# Altium project MEZONNINE.PrjPcb
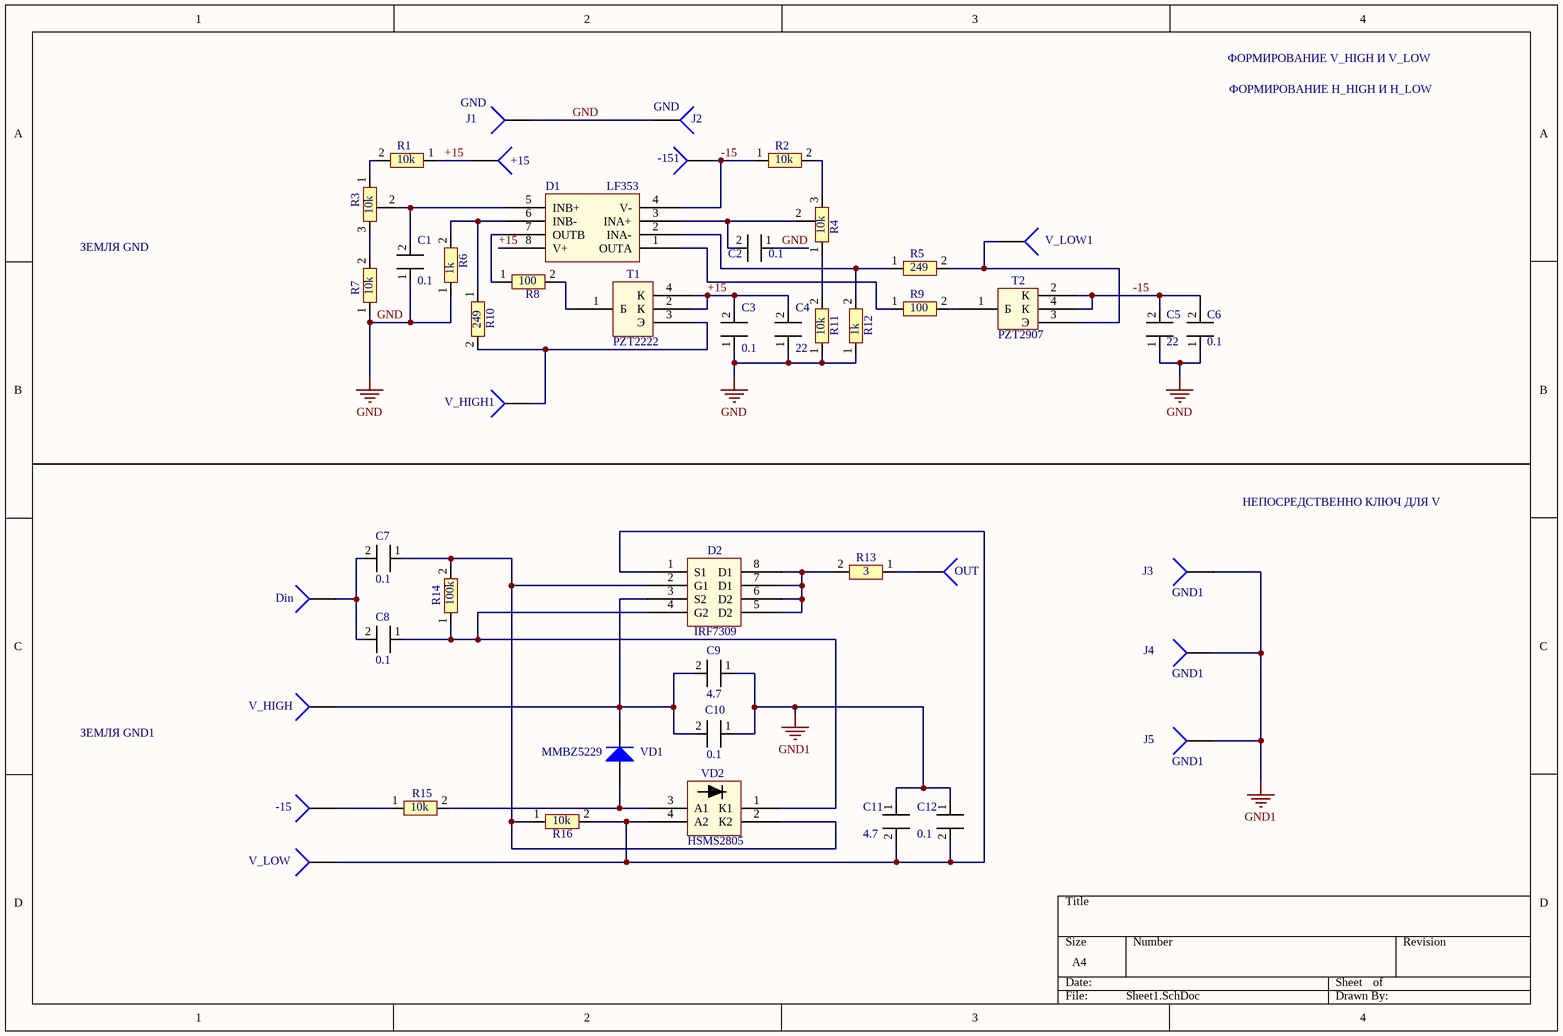
[diagram p0: Sheet1.SchDoc]
2 sheets, 69 parts. Net scope: global (net labels, ports and power ports of the same name join across sheets).
Board files: PCB.PcbDoc, V.PcbDoc, H.PcbDoc, V+H.PcbDoc
Sheets:
  Sheet1.SchDoc
  Sheet2.SchDoc

## Sheet Sheet1.SchDoc
size A4

### Parts
+15  (no value)  [PIN1]
-15  (no value)  [PIN1]
-151  (no value)  [PIN1]
C1  0.1  [CAP_SMALL]
C2  0.1  [CAP_SMALL]
C3  0.1  [CAP_SMALL]
C4  22  [Cap_BIG]
C5  22  [Cap_BIG]
C6  0.1  [CAP_SMALL]
C7  0.1  [CAP_SMALL]
C8  0.1  [CAP_SMALL]
C9  4.7  [CAP_SMALL]
C10  0.1  [CAP_SMALL]
C11  4.7  [CAP_SMALL]
C12  0.1  [CAP_SMALL]
D1  LF353  [SOIC127P600X175-8N]
D2  IRF7309  [SOIC127P600X175-8N]
Din  (no value)  [PIN1]
J1  GND  [PIN1]
J2  GND  [PIN1]
J3  GND1  [PIN1]
J4  GND1  [PIN1]
J5  GND1  [PIN1]
OUT  (no value)  [PIN1]
R1  10k  [RES]
R2  10k  [RES]
R3  10k  [PODSR_RES]
R4  10k  [PODSR_RES]
R5  249  [RES]
R6  1k  [RES]
R7  10k  [RES]
R8  100  [RES]
R9  100  [RES]
R10  249  [RES]
R11  10k  [RES]
R12  1k  [RES]
R13  3  [RES]
R14  100k  [RES]
R15  10k  [RES]
R16  10k  [RES]
T1  PZT2222  [SOT230P700X180-4N]
T2  PZT2907  [SOT230P700X180-4N]
V_HIGH  (no value)  [PIN1]
V_HIGH1  (no value)  [PIN1]
V_LOW  (no value)  [PIN1]
V_LOW1  (no value)  [PIN1]
VD1  MMBZ5229  [SOT-23_N]
VD2  HSMS2805  [SOT-143B]

### Nets
GND: C1.1 C2.1 C3.1 C4.1 C5.1 C6.1 J1.1 J2.1 R6.1 R7.1 R11.1 R12.1
GND1: C9.1 C10.1 C11.1 C12.1 J3.1 J4.1 J5.1
+15: +15.1 C3.2 C4.2 D1.8(V+) R1.1 T1.2(К) T1.4(К)
-15: -151.1 C5.2 C6.2 D1.4(V-) R2.1 T2.2(К) T2.4(К)
Net-15_1: -15.1 R15.1
NetC1_2: C1.2 D1.5(INB+) R3.2
NetC2_2: C2.2 D1.3(INA+) R4.2
NetC7_1: C7.1 D2.2(G1) R14.2 R16.1 VD2.2(К2)
NetC7_2: C7.2 C8.2 Din.1
NetC8_1: C8.1 D2.4(G2) R14.1 VD2.1(К1)
NetC9_2: C9.2 C10.2 D2.3(S2) V_HIGH.1 VD1.3(K)
NetC11_2: C11.2 C12.2 D2.1(S1) R16.2 V_LOW.1 VD2.4(А2)
NetD1_1: D1.1(OUTA) R9.1
NetD1_2: D1.2(INA-) R5.1 R12.2
NetD1_6: D1.6(INB-) R6.2 R10.1
NetD1_7: D1.7(OUTB) R8.1
NetD2_5: D2.5(D2) D2.6(D2) D2.7(D1) D2.8(D1) R13.2
NetOUT_1: OUT.1 R13.1
NetR1_2: R1.2 R3.1
NetR2_2: R2.2 R4.3
NetR3_3: R3.3 R7.2
NetR4_1: R4.1 R11.2
NetR5_2: R5.2 T2.3(Э) V_LOW1.1
NetR8_2: R8.2 T1.1(Б)
NetR9_2: R9.2 T2.1(Б)
NetR10_2: R10.2 T1.3(Э) V_HIGH1.1
NetR15_2: R15.2 VD1.1(A) VD2.3(А1)

### Notes on the sheet
- ФОРМИРОВАНИЕ V_HIGH И V_LOW
- ФОРМИРОВАНИЕ H_HIGH И H_LOW
- ЗЕМЛЯ GND
- НЕПОСРЕДСТВЕННО КЛЮЧ ДЛЯ V
- ЗЕМЛЯ GND1

### Library data of the parts
+15 -15 -151 Din J1-J5 OUT V_HIGH V_HIGH1 V_LOW V_LOW1 = Socket: LatestRevisionDate: 17-Jul-2002; LatestRevisionNote: Re-released for DXP Platform.; Publisher: Altium Limited
C1-C3 C6-C12 = CAP_SMALL
C4 C5 = CAP_BIG
R1 R2 R5-R16 = RES
R3 R4 = RES_PODSTR
T1 = PZT2222A
T2 = PZT2907A
VD1 = Diode BAS16: Silicon Switching Diode for High-Speed Switching; Note: Pin 2 is not connected and not drawn.; Published: 21-Mar-2003; LatestRevisionDate: 29-May-2009; LatestRevisionNote: IPC-7351 Footprint Added.; DatasheetVersion: Oct-1999; PackageVersion: Sep-2001; PackageReference: SOT-23; Publisher: Altium Limited; PackageDescription: 3-Pin SOT-23 Package 0.95 mm Pitch, 2.5 mm Lead Span; ComponentLink1Description: Manufacturer Link; ComponentLink1URL: http://www.infineon.com/; ComponentLink2Description: Datasheet; ComponentLink2URL: http://www.infineon.com/upload/Document/cmc_upload/documents/012/5331/bas16series.pdf
VD2 = HSMS-2805

## Sheet Sheet2.SchDoc
size A4
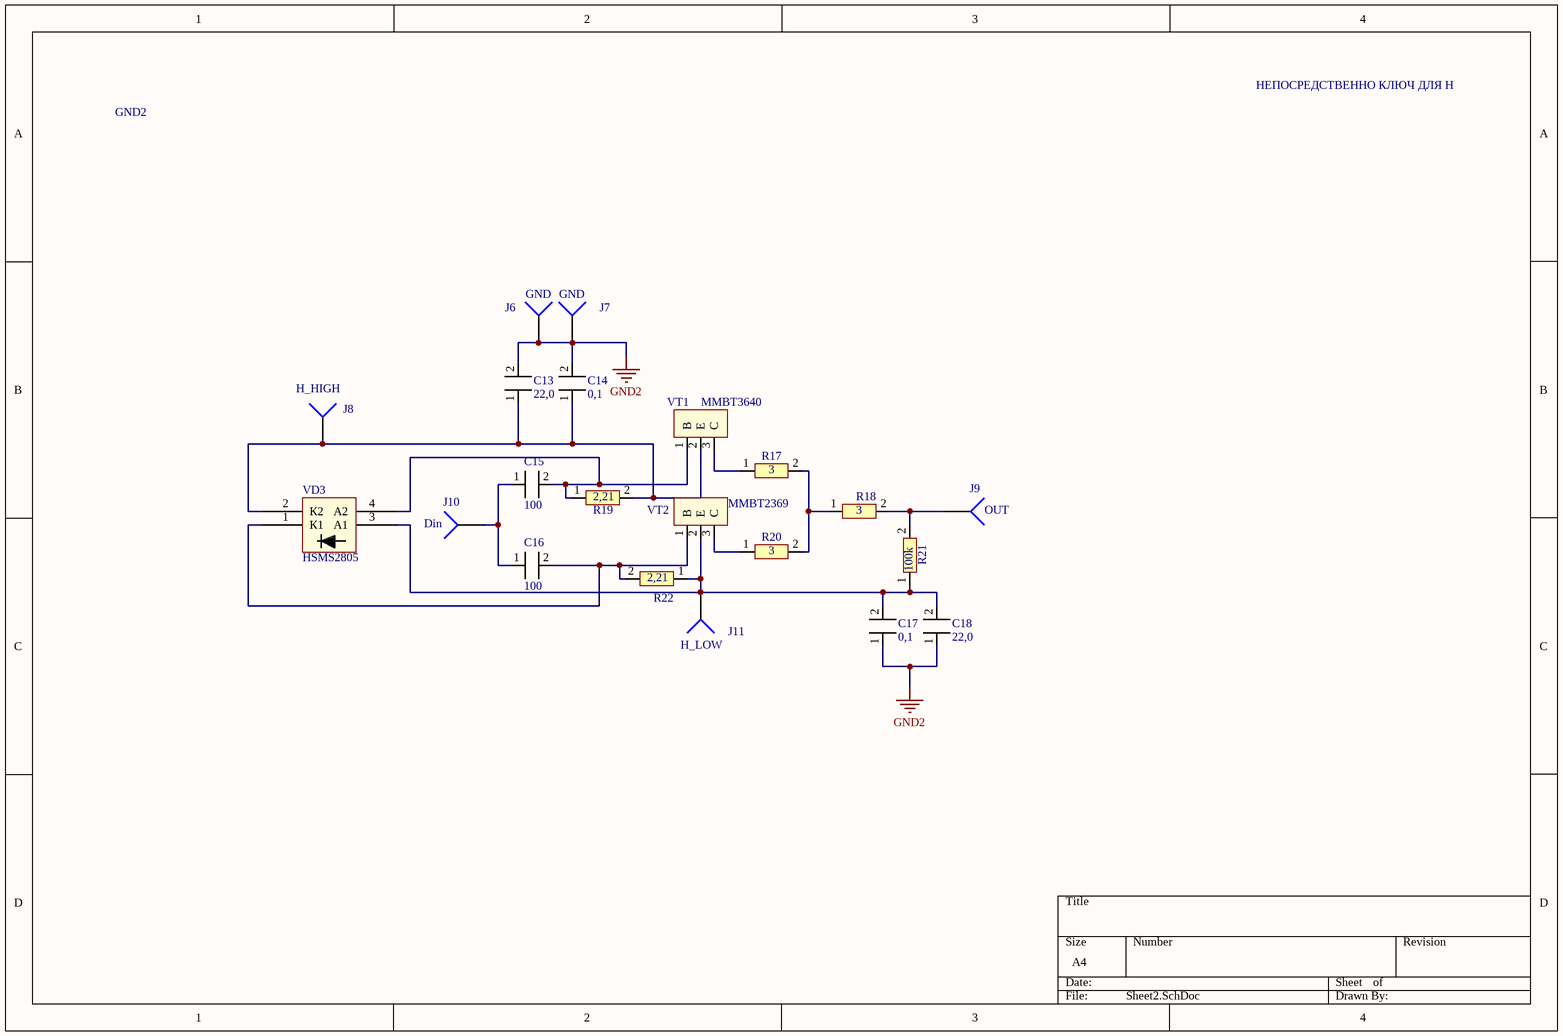
[diagram p1: Sheet2.SchDoc]

### Parts
C13  22,0  [Cap_BIG]
C14  0,1  [CAP_SMALL]
C15  100  [CAP_SMALL]
C16  100  [CAP_SMALL]
C17  0,1  [CAP_SMALL]
C18  22,0  [Cap_BIG]
J6  GND  [PIN1]
J7  GND  [PIN1]
J8  H_HIGH  [PIN1]
J9  OUT  [PIN1]
J10  Din  [PIN1]
J11  H_LOW  [PIN1]
R17  3  [RES]
R18  3  [RES]
R19  2,21  [RES]
R20  3  [RES]
R21  100k  [RES]
R22  2,21  [RES]
VD3  HSMS2805  [SOT-143B]
VT1  MMBT3640  [SOT23-BEC_MMBT3640*(Primary)]
VT2  MMBT2369  [SOT23-BEC_MMBT3640*(Primary)]

### Nets
GND2: C13.2 C14.2 C17.1 C18.1 J6.1 J7.1
NetC13_1: C13.1 C14.1 J8.1 R19.2 VD3.2(К2) VT1.2(E)
NetC15_1: C15.1 C16.1 J10.1
NetC15_2: C15.2 R19.1 VD3.4(А2) VT1.1(B)
NetC16_2: C16.2 R22.2 VD3.1(К1) VT2.1(B)
NetC17_2: C17.2 C18.2 J11.1 R21.1 R22.1 VD3.3(А1) VT2.2(E)
NetJ9_1: J9.1 R18.2 R21.2
NetR17_1: R17.1 VT1.3(C)
NetR17_2: R17.2 R18.1 R20.2
NetR20_1: R20.1 VT2.3(C)

### Notes on the sheet
- GND2
- НЕПОСРЕДСТВЕННО КЛЮЧ ДЛЯ H

### Library data of the parts
C13 C18 = CAP_BIG
C14-C17 = CAP_SMALL
J6-J11 = Socket: LatestRevisionDate: 17-Jul-2002; LatestRevisionNote: Re-released for DXP Platform.; Publisher: Altium Limited
R17-R22 = RES
VD3 = HSMS-2805